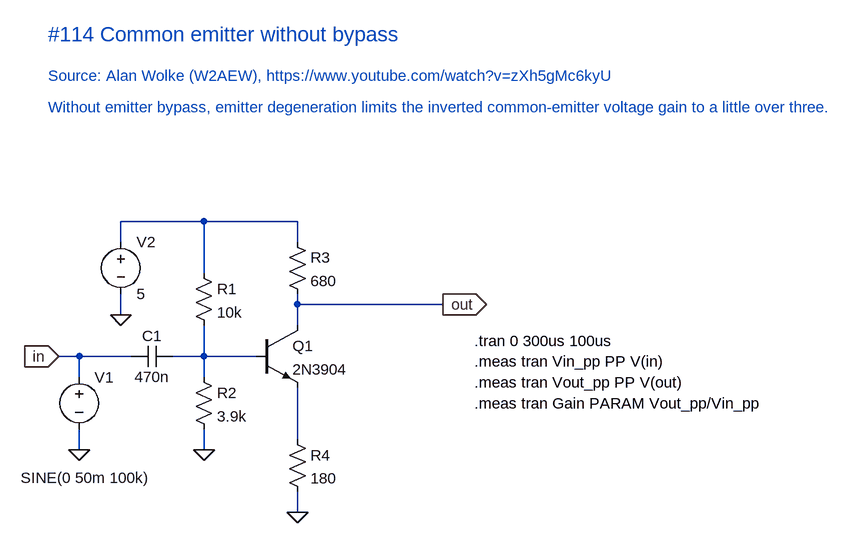
[diagram p0: schematic Common Emitter Unbypassed.asc]
Common Emitter Unbypassed.asc, the LTspice schematic file:
Version 4.1
SHEET 1 1572 680
WIRE 560 -112 432 -112
WIRE 704 -112 560 -112
WIRE 432 -80 432 -112
WIRE 704 -80 704 -112
WIRE 560 -32 560 -112
WIRE 704 16 704 0
WIRE 928 16 704 16
WIRE 432 32 432 0
WIRE 704 48 704 16
WIRE 368 96 336 96
WIRE 448 96 368 96
WIRE 560 96 560 48
WIRE 560 96 512 96
WIRE 640 96 560 96
WIRE 368 128 368 96
WIRE 560 128 560 96
WIRE 704 192 704 144
WIRE 704 224 704 192
WIRE 368 240 368 208
WIRE 560 240 560 208
WIRE 704 336 704 304
FLAG 432 32 0
FLAG 368 240 0
FLAG 704 336 0
FLAG 560 240 0
FLAG 336 96 in
IOPIN 336 96 In
SYMBOL voltage 432 -96 R0
WINDOW 123 0 0 Left 0
WINDOW 39 0 0 Left 0
SYMATTR InstName V2
SYMATTR Value 5
SYMBOL voltage 368 112 R0
WINDOW 3 -90 171 Left 2
WINDOW 123 0 0 Left 0
WINDOW 39 0 0 Left 0
SYMATTR Value SINE(0 50m 100k)
SYMATTR InstName V1
SYMBOL res 544 -48 R0
SYMATTR InstName R1
SYMATTR Value 10k
SYMBOL res 544 112 R0
SYMATTR InstName R2
SYMATTR Value 3.9k
SYMBOL npn 640 48 R0
SYMATTR InstName Q1
SYMATTR Value 2N3904
SYMBOL res 688 -96 R0
SYMATTR InstName R3
SYMATTR Value 680
SYMBOL res 688 208 R0
SYMATTR InstName R4
SYMATTR Value 180
SYMBOL cap 512 80 R90
WINDOW 0 0 32 VBottom 2
WINDOW 3 32 32 VTop 2
SYMATTR InstName C1
SYMATTR Value 470n
FLAG 928 16 out
IOPIN 928 16 Out
TEXT 976 72 Left 2 !.tran 0 300us 100us
TEXT 976 104 Left 2 !.meas tran Vin_pp PP V(in)
TEXT 976 136 Left 2 !.meas tran Vout_pp PP V(out)
TEXT 976 168 Left 2 !.meas tran Gain PARAM Vout_pp/Vin_pp
TEXT 320 -400 Left 3 ;#114 Common emitter without bypass
TEXT 320 -336 Left 2 ;Source: Alan Wolke (W2AEW), https://www.youtube.com/watch?v=zXh5gMc6kyU
TEXT 320 -288 Left 2 ;Without emitter bypass, emitter degeneration limits the inverted common-emitter voltage gain to a little over three.

The netlist it stands for:
* Common Emitter Unbypassed.asc
V2 N001 0 5
V1 in 0 SINE(0 50m 100k)
R1 N001 N002 10k
R2 N002 0 3.9k
Q1 out N002 N003 0 2N3904
R3 N001 out 680
R4 N003 0 180
C1 N002 in 470n
.model NPN NPN
.model PNP PNP
.lib standard.bjt
.tran 0 300us 100us
.meas tran Vin_pp PP V(in)
.meas tran Vout_pp PP V(out)
.meas tran Gain PARAM Vout_pp/Vin_pp
* #114 Common emitter without bypass
* Source: Alan Wolke (W2AEW), https://www.youtube.com/watch?v=zXh5gMc6kyU
* Without emitter bypass, emitter degeneration limits the inverted common-emitter voltage gain to a little over three.
.backanno
.end